# Altium project LED-PCBs.PrjPcb (part 1 of 2)
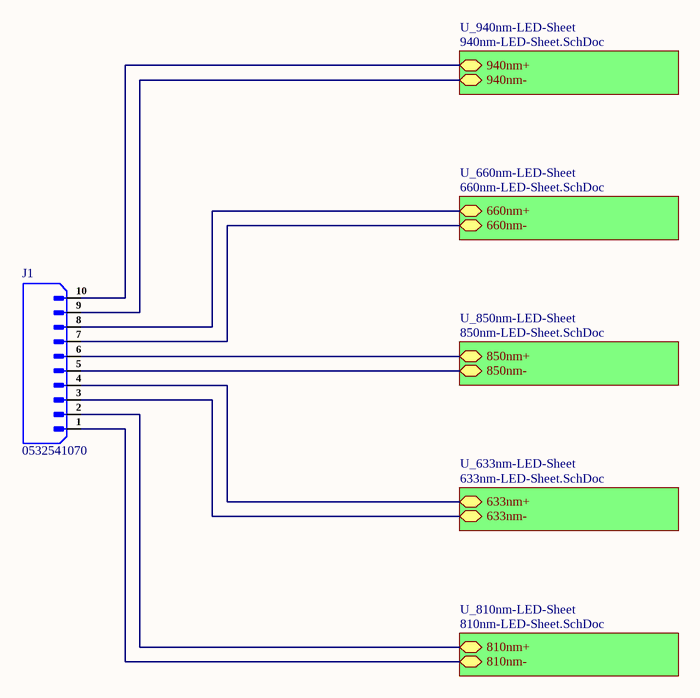
[diagram p0: Main-Sheet.SchDoc]
6 sheets, 801 parts. Net scope: hierarchical (ports join the sheet entries above them; power ports are global).
Sheets:
  Main-Sheet.SchDoc
    U_633nm-LED-Sheet = 633nm-LED-Sheet.SchDoc
    U_660nm-LED-Sheet = 660nm-LED-Sheet.SchDoc
    U_810nm-LED-Sheet = 810nm-LED-Sheet.SchDoc
    U_850nm-LED-Sheet = 850nm-LED-Sheet.SchDoc
    U_940nm-LED-Sheet = 940nm-LED-Sheet.SchDoc

## Sheet Main-Sheet.SchDoc
size 420 x 297 mm; SheetNumber: 1; SheetTotal: 6

### Parts
J1  0532541070  [0532541070]

### Sub-sheets
U_633nm-LED-Sheet = 633nm-LED-Sheet.SchDoc: 633nm+ (bidir), 633nm- (bidir)
U_660nm-LED-Sheet = 660nm-LED-Sheet.SchDoc: 660nm+ (bidir), 660nm- (bidir)
U_810nm-LED-Sheet = 810nm-LED-Sheet.SchDoc: 810nm+ (bidir), 810nm- (bidir)
U_850nm-LED-Sheet = 850nm-LED-Sheet.SchDoc: 850nm+ (bidir), 850nm- (bidir)
U_940nm-LED-Sheet = 940nm-LED-Sheet.SchDoc: 940nm+ (bidir), 940nm- (bidir)

### Nets
633nm+: J1.4 ; sheet U_633nm-LED-Sheet/633nm+
633nm-: J1.3 ; sheet U_633nm-LED-Sheet/633nm-
660nm+: J1.8 ; sheet U_660nm-LED-Sheet/660nm+
660nm-: J1.7 ; sheet U_660nm-LED-Sheet/660nm-
810nm+: J1.2 ; sheet U_810nm-LED-Sheet/810nm+
810nm-: J1.1 ; sheet U_810nm-LED-Sheet/810nm-
850nm+: J1.6 ; sheet U_850nm-LED-Sheet/850nm+
850nm-: J1.5 ; sheet U_850nm-LED-Sheet/850nm-
940nm+: J1.10 ; sheet U_940nm-LED-Sheet/940nm+
940nm-: J1.9 ; sheet U_940nm-LED-Sheet/940nm-

### Notes on the sheet
- File:
- Title:
- Date:
- Page
- Num:
- Total:
- Drawn By: Huzaifa Ali

### Library data of the parts
J1 = 0532541070: CONN HEADER R/A 10POS 2MM; Manufacturer: Molex; Manufacturer Part Number: 53254-1070; Item Type: Headers and Wire Housings; Plating: Tin; Voltage Rating: 125V; Current Rating: 2A; Number of Positions: 10; Gender: Male; Number of Circuits: 9; Glow Wire Compliant: Non-compliant; Supplier: Arrow Electronics; Supplier Part Number: 53254-1070; RoHS: Yes; Stock: 4800; Pricing: 4800=0.2383, 6000=0.2327, 10000=0.2292, 20000=0.2263, 30000=0.2219, 50000=0.2176, 100000=0.2136 (USD); Mounting Technology: Through Hole; Contact Plating: Tin; Contact Material: Brass; Housing Material: Nylon; Min Operating Temperature: -40°C; Max Operating Temperature: 105°C; Number of Rows: 1; Packaging: Tray; Contact Gender: Male; Termination: Through Hole; Number of Contacts: 10; Orientation: Right Angle; Series: 53254; Pitch: 2mm; RoHS Compliant: Yes; Reach SVHC Compliant: Unknown; ComponentLink1URL: https://datasheet.ciiva.com/7810/0532541070-pcb-headers-7810534.pdf?src-supplier=Element14; ComponentLink1Description: https://datasheet.ciiva.com/7810/0532541070-pcb-headers-7810534.pdf?src-supplier=Element14

## Sheet 633nm-LED-Sheet.SchDoc
size 420 x 297 mm; SheetNumber: 2; SheetTotal: 6
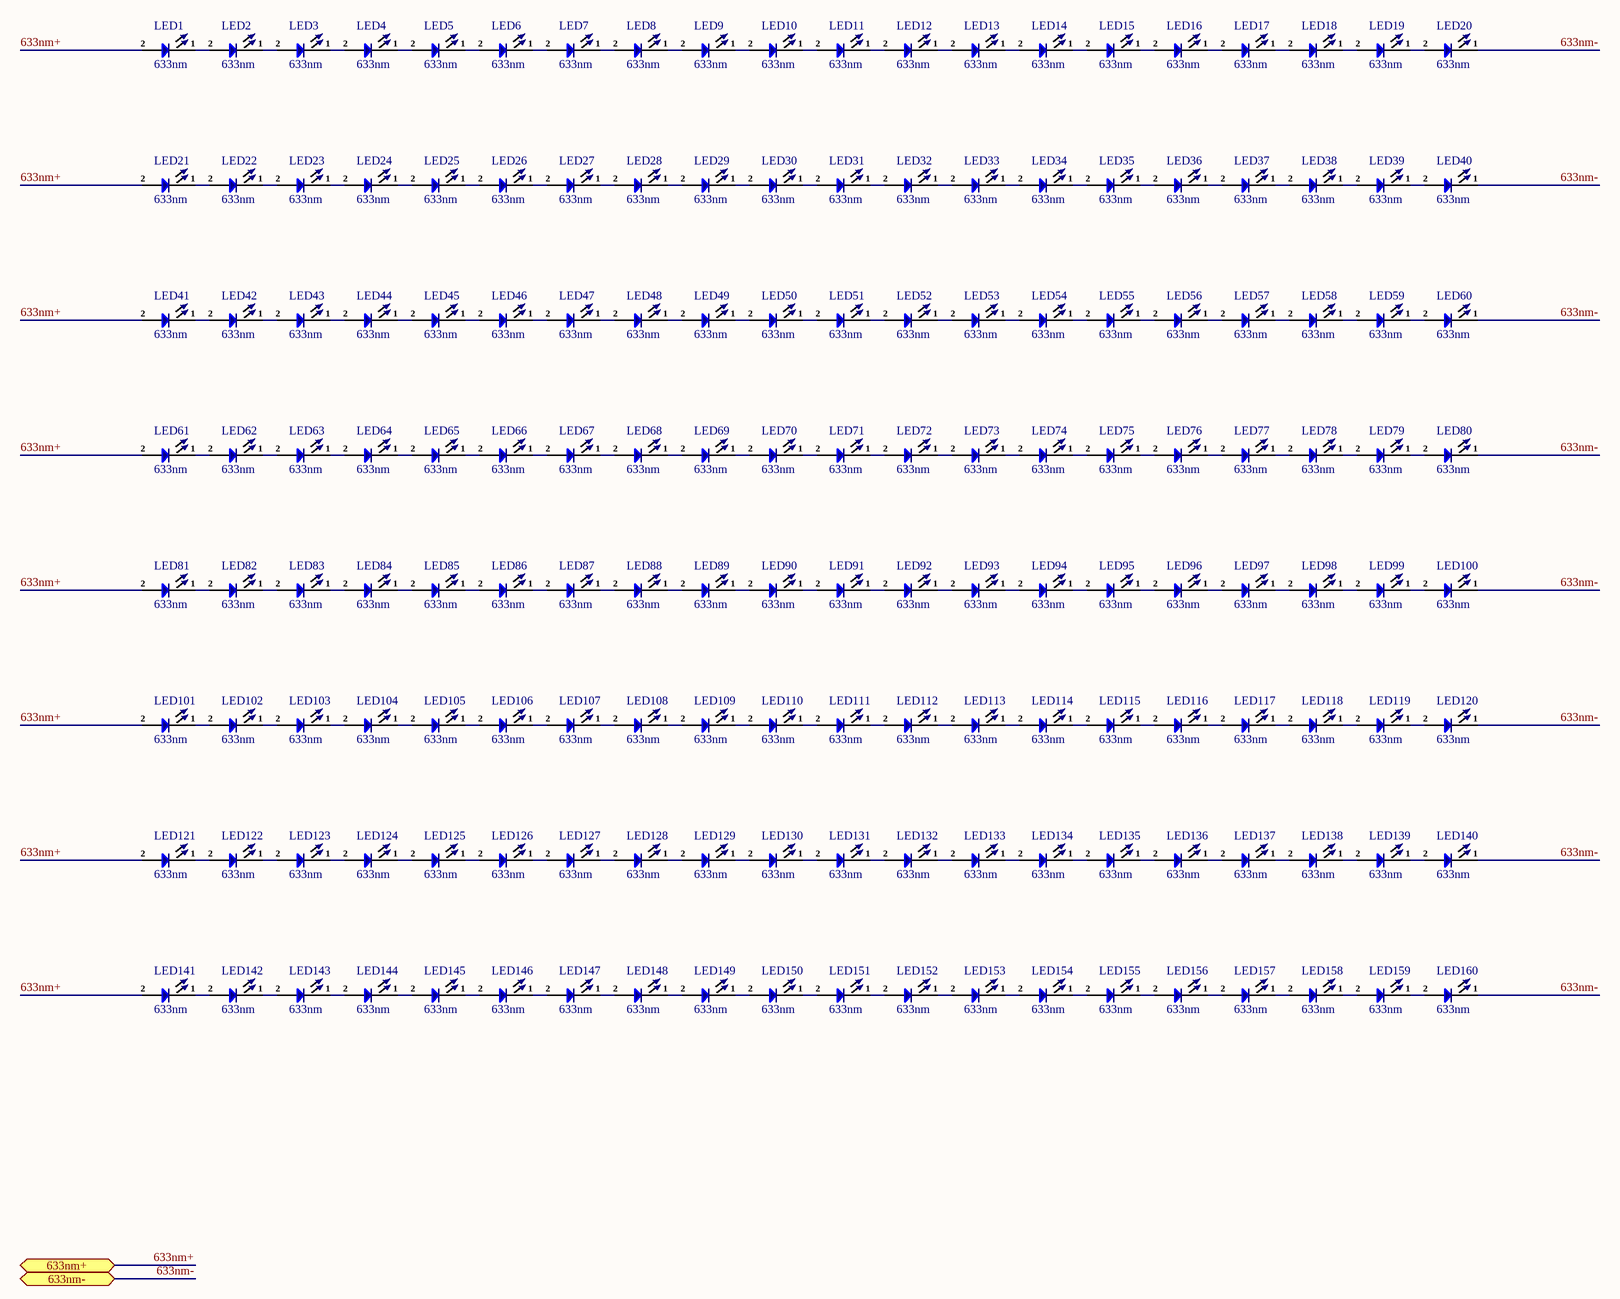
[diagram p1: 633nm-LED-Sheet.SchDoc]

### Parts
LED1  633nm  [TH LED 3mm_]
LED2  633nm  [TH LED 3mm_]
LED3  633nm  [TH LED 3mm_]
LED4  633nm  [TH LED 3mm_]
LED5  633nm  [TH LED 3mm_]
LED6  633nm  [TH LED 3mm_]
LED7  633nm  [TH LED 3mm_]
LED8  633nm  [TH LED 3mm_]
LED9  633nm  [TH LED 3mm_]
LED10  633nm  [TH LED 3mm_]
LED11  633nm  [TH LED 3mm_]
LED12  633nm  [TH LED 3mm_]
LED13  633nm  [TH LED 3mm_]
LED14  633nm  [TH LED 3mm_]
LED15  633nm  [TH LED 3mm_]
LED16  633nm  [TH LED 3mm_]
LED17  633nm  [TH LED 3mm_]
LED18  633nm  [TH LED 3mm_]
LED19  633nm  [TH LED 3mm_]
LED20  633nm  [TH LED 3mm_]
LED21  633nm  [TH LED 3mm_]
LED22  633nm  [TH LED 3mm_]
LED23  633nm  [TH LED 3mm_]
LED24  633nm  [TH LED 3mm_]
LED25  633nm  [TH LED 3mm_]
LED26  633nm  [TH LED 3mm_]
LED27  633nm  [TH LED 3mm_]
LED28  633nm  [TH LED 3mm_]
LED29  633nm  [TH LED 3mm_]
LED30  633nm  [TH LED 3mm_]
LED31  633nm  [TH LED 3mm_]
LED32  633nm  [TH LED 3mm_]
LED33  633nm  [TH LED 3mm_]
LED34  633nm  [TH LED 3mm_]
LED35  633nm  [TH LED 3mm_]
LED36  633nm  [TH LED 3mm_]
LED37  633nm  [TH LED 3mm_]
LED38  633nm  [TH LED 3mm_]
LED39  633nm  [TH LED 3mm_]
LED40  633nm  [TH LED 3mm_]
LED41  633nm  [TH LED 3mm_]
LED42  633nm  [TH LED 3mm_]
LED43  633nm  [TH LED 3mm_]
LED44  633nm  [TH LED 3mm_]
LED45  633nm  [TH LED 3mm_]
LED46  633nm  [TH LED 3mm_]
LED47  633nm  [TH LED 3mm_]
LED48  633nm  [TH LED 3mm_]
LED49  633nm  [TH LED 3mm_]
LED50  633nm  [TH LED 3mm_]
LED51  633nm  [TH LED 3mm_]
LED52  633nm  [TH LED 3mm_]
LED53  633nm  [TH LED 3mm_]
LED54  633nm  [TH LED 3mm_]
LED55  633nm  [TH LED 3mm_]
LED56  633nm  [TH LED 3mm_]
LED57  633nm  [TH LED 3mm_]
LED58  633nm  [TH LED 3mm_]
LED59  633nm  [TH LED 3mm_]
LED60  633nm  [TH LED 3mm_]
LED61  633nm  [TH LED 3mm_]
LED62  633nm  [TH LED 3mm_]
LED63  633nm  [TH LED 3mm_]
LED64  633nm  [TH LED 3mm_]
LED65  633nm  [TH LED 3mm_]
LED66  633nm  [TH LED 3mm_]
LED67  633nm  [TH LED 3mm_]
LED68  633nm  [TH LED 3mm_]
LED69  633nm  [TH LED 3mm_]
LED70  633nm  [TH LED 3mm_]
LED71  633nm  [TH LED 3mm_]
LED72  633nm  [TH LED 3mm_]
LED73  633nm  [TH LED 3mm_]
LED74  633nm  [TH LED 3mm_]
LED75  633nm  [TH LED 3mm_]
LED76  633nm  [TH LED 3mm_]
LED77  633nm  [TH LED 3mm_]
LED78  633nm  [TH LED 3mm_]
LED79  633nm  [TH LED 3mm_]
LED80  633nm  [TH LED 3mm_]
LED81  633nm  [TH LED 3mm_]
LED82  633nm  [TH LED 3mm_]
LED83  633nm  [TH LED 3mm_]
LED84  633nm  [TH LED 3mm_]
LED85  633nm  [TH LED 3mm_]
LED86  633nm  [TH LED 3mm_]
LED87  633nm  [TH LED 3mm_]
LED88  633nm  [TH LED 3mm_]
LED89  633nm  [TH LED 3mm_]
LED90  633nm  [TH LED 3mm_]
LED91  633nm  [TH LED 3mm_]
LED92  633nm  [TH LED 3mm_]
LED93  633nm  [TH LED 3mm_]
LED94  633nm  [TH LED 3mm_]
LED95  633nm  [TH LED 3mm_]
LED96  633nm  [TH LED 3mm_]
LED97  633nm  [TH LED 3mm_]
LED98  633nm  [TH LED 3mm_]
LED99  633nm  [TH LED 3mm_]
LED100  633nm  [TH LED 3mm_]
LED101  633nm  [TH LED 3mm_]
LED102  633nm  [TH LED 3mm_]
LED103  633nm  [TH LED 3mm_]
LED104  633nm  [TH LED 3mm_]
LED105  633nm  [TH LED 3mm_]
LED106  633nm  [TH LED 3mm_]
LED107  633nm  [TH LED 3mm_]
LED108  633nm  [TH LED 3mm_]
LED109  633nm  [TH LED 3mm_]
LED110  633nm  [TH LED 3mm_]
LED111  633nm  [TH LED 3mm_]
LED112  633nm  [TH LED 3mm_]
LED113  633nm  [TH LED 3mm_]
LED114  633nm  [TH LED 3mm_]
LED115  633nm  [TH LED 3mm_]
LED116  633nm  [TH LED 3mm_]
LED117  633nm  [TH LED 3mm_]
LED118  633nm  [TH LED 3mm_]
LED119  633nm  [TH LED 3mm_]
LED120  633nm  [TH LED 3mm_]
LED121  633nm  [TH LED 3mm_]
LED122  633nm  [TH LED 3mm_]
LED123  633nm  [TH LED 3mm_]
LED124  633nm  [TH LED 3mm_]
LED125  633nm  [TH LED 3mm_]
LED126  633nm  [TH LED 3mm_]
LED127  633nm  [TH LED 3mm_]
LED128  633nm  [TH LED 3mm_]
LED129  633nm  [TH LED 3mm_]
LED130  633nm  [TH LED 3mm_]
LED131  633nm  [TH LED 3mm_]
LED132  633nm  [TH LED 3mm_]
LED133  633nm  [TH LED 3mm_]
LED134  633nm  [TH LED 3mm_]
LED135  633nm  [TH LED 3mm_]
LED136  633nm  [TH LED 3mm_]
LED137  633nm  [TH LED 3mm_]
LED138  633nm  [TH LED 3mm_]
LED139  633nm  [TH LED 3mm_]
LED140  633nm  [TH LED 3mm_]
LED141  633nm  [TH LED 3mm_]
LED142  633nm  [TH LED 3mm_]
LED143  633nm  [TH LED 3mm_]
LED144  633nm  [TH LED 3mm_]
LED145  633nm  [TH LED 3mm_]
LED146  633nm  [TH LED 3mm_]
LED147  633nm  [TH LED 3mm_]
LED148  633nm  [TH LED 3mm_]
LED149  633nm  [TH LED 3mm_]
LED150  633nm  [TH LED 3mm_]
LED151  633nm  [TH LED 3mm_]
LED152  633nm  [TH LED 3mm_]
LED153  633nm  [TH LED 3mm_]
LED154  633nm  [TH LED 3mm_]
LED155  633nm  [TH LED 3mm_]
LED156  633nm  [TH LED 3mm_]
LED157  633nm  [TH LED 3mm_]
LED158  633nm  [TH LED 3mm_]
LED159  633nm  [TH LED 3mm_]
LED160  633nm  [TH LED 3mm_]

### Ports
633nm+ (bidir, see Main-Sheet[4B]), 633nm- (bidir, see Main-Sheet[4B])

### Nets
633nm+: LED1.2 LED21.2 LED41.2 LED61.2 LED81.2 LED101.2 LED121.2 LED141.2 ; port 633nm+
633nm-: LED20.1 LED40.1 LED60.1 LED80.1 LED100.1 LED120.1 LED140.1 LED160.1 ; port 633nm-
NetLED1_1: LED1.1 LED2.2
NetLED2_1: LED2.1 LED3.2
NetLED3_1: LED3.1 LED4.2
NetLED4_1: LED4.1 LED5.2
NetLED5_1: LED5.1 LED6.2
NetLED6_1: LED6.1 LED7.2
NetLED7_1: LED7.1 LED8.2
NetLED8_1: LED8.1 LED9.2
NetLED9_1: LED9.1 LED10.2
NetLED10_1: LED10.1 LED11.2
NetLED11_1: LED11.1 LED12.2
NetLED12_1: LED12.1 LED13.2
NetLED13_1: LED13.1 LED14.2
NetLED14_1: LED14.1 LED15.2
NetLED15_1: LED15.1 LED16.2
NetLED16_1: LED16.1 LED17.2
NetLED17_1: LED17.1 LED18.2
NetLED18_1: LED18.1 LED19.2
NetLED19_1: LED19.1 LED20.2
NetLED21_1: LED21.1 LED22.2
NetLED22_1: LED22.1 LED23.2
NetLED23_1: LED23.1 LED24.2
NetLED24_1: LED24.1 LED25.2
NetLED25_1: LED25.1 LED26.2
NetLED26_1: LED26.1 LED27.2
NetLED27_1: LED27.1 LED28.2
NetLED28_1: LED28.1 LED29.2
NetLED29_1: LED29.1 LED30.2
NetLED30_1: LED30.1 LED31.2
NetLED31_1: LED31.1 LED32.2
NetLED32_1: LED32.1 LED33.2
NetLED33_1: LED33.1 LED34.2
NetLED34_1: LED34.1 LED35.2
NetLED35_1: LED35.1 LED36.2
NetLED36_1: LED36.1 LED37.2
NetLED37_1: LED37.1 LED38.2
NetLED38_1: LED38.1 LED39.2
NetLED39_1: LED39.1 LED40.2
NetLED41_1: LED41.1 LED42.2
NetLED42_1: LED42.1 LED43.2
NetLED43_1: LED43.1 LED44.2
NetLED44_1: LED44.1 LED45.2
NetLED45_1: LED45.1 LED46.2
NetLED46_1: LED46.1 LED47.2
NetLED47_1: LED47.1 LED48.2
NetLED48_1: LED48.1 LED49.2
NetLED49_1: LED49.1 LED50.2
NetLED50_1: LED50.1 LED51.2
NetLED51_1: LED51.1 LED52.2
NetLED52_1: LED52.1 LED53.2
NetLED53_1: LED53.1 LED54.2
NetLED54_1: LED54.1 LED55.2
NetLED55_1: LED55.1 LED56.2
NetLED56_1: LED56.1 LED57.2
NetLED57_1: LED57.1 LED58.2
NetLED58_1: LED58.1 LED59.2
NetLED59_1: LED59.1 LED60.2
NetLED61_1: LED61.1 LED62.2
NetLED62_1: LED62.1 LED63.2
NetLED63_1: LED63.1 LED64.2
NetLED64_1: LED64.1 LED65.2
NetLED65_1: LED65.1 LED66.2
NetLED66_1: LED66.1 LED67.2
NetLED67_1: LED67.1 LED68.2
NetLED68_1: LED68.1 LED69.2
NetLED69_1: LED69.1 LED70.2
NetLED70_1: LED70.1 LED71.2
NetLED71_1: LED71.1 LED72.2
NetLED72_1: LED72.1 LED73.2
NetLED73_1: LED73.1 LED74.2
NetLED74_1: LED74.1 LED75.2
NetLED75_1: LED75.1 LED76.2
NetLED76_1: LED76.1 LED77.2
NetLED77_1: LED77.1 LED78.2
NetLED78_1: LED78.1 LED79.2
NetLED79_1: LED79.1 LED80.2
NetLED81_1: LED81.1 LED82.2
NetLED82_1: LED82.1 LED83.2
NetLED83_1: LED83.1 LED84.2
NetLED84_1: LED84.1 LED85.2
NetLED85_1: LED85.1 LED86.2
NetLED86_1: LED86.1 LED87.2
NetLED87_1: LED87.1 LED88.2
NetLED88_1: LED88.1 LED89.2
NetLED89_1: LED89.1 LED90.2
NetLED90_1: LED90.1 LED91.2
NetLED91_1: LED91.1 LED92.2
NetLED92_1: LED92.1 LED93.2
NetLED93_1: LED93.1 LED94.2
NetLED94_1: LED94.1 LED95.2
NetLED95_1: LED95.1 LED96.2
NetLED96_1: LED96.1 LED97.2
NetLED97_1: LED97.1 LED98.2
NetLED98_1: LED98.1 LED99.2
NetLED99_1: LED99.1 LED100.2
NetLED101_1: LED101.1 LED102.2
NetLED102_1: LED102.1 LED103.2
NetLED103_1: LED103.1 LED104.2
NetLED104_1: LED104.1 LED105.2
NetLED105_1: LED105.1 LED106.2
NetLED106_1: LED106.1 LED107.2
NetLED107_1: LED107.1 LED108.2
NetLED108_1: LED108.1 LED109.2
NetLED109_1: LED109.1 LED110.2
NetLED110_1: LED110.1 LED111.2
NetLED111_1: LED111.1 LED112.2
NetLED112_1: LED112.1 LED113.2
NetLED113_1: LED113.1 LED114.2
NetLED114_1: LED114.1 LED115.2
NetLED115_1: LED115.1 LED116.2
NetLED116_1: LED116.1 LED117.2
NetLED117_1: LED117.1 LED118.2
NetLED118_1: LED118.1 LED119.2
NetLED119_1: LED119.1 LED120.2
NetLED121_1: LED121.1 LED122.2
NetLED122_1: LED122.1 LED123.2
NetLED123_1: LED123.1 LED124.2
NetLED124_1: LED124.1 LED125.2
NetLED125_1: LED125.1 LED126.2
NetLED126_1: LED126.1 LED127.2
NetLED127_1: LED127.1 LED128.2
NetLED128_1: LED128.1 LED129.2
NetLED129_1: LED129.1 LED130.2
NetLED130_1: LED130.1 LED131.2
NetLED131_1: LED131.1 LED132.2
NetLED132_1: LED132.1 LED133.2
NetLED133_1: LED133.1 LED134.2
NetLED134_1: LED134.1 LED135.2
NetLED135_1: LED135.1 LED136.2
NetLED136_1: LED136.1 LED137.2
NetLED137_1: LED137.1 LED138.2
NetLED138_1: LED138.1 LED139.2
NetLED139_1: LED139.1 LED140.2
NetLED141_1: LED141.1 LED142.2
NetLED142_1: LED142.1 LED143.2
NetLED143_1: LED143.1 LED144.2
NetLED144_1: LED144.1 LED145.2
NetLED145_1: LED145.1 LED146.2
NetLED146_1: LED146.1 LED147.2
NetLED147_1: LED147.1 LED148.2
NetLED148_1: LED148.1 LED149.2
NetLED149_1: LED149.1 LED150.2
NetLED150_1: LED150.1 LED151.2
NetLED151_1: LED151.1 LED152.2
NetLED152_1: LED152.1 LED153.2
NetLED153_1: LED153.1 LED154.2
NetLED154_1: LED154.1 LED155.2
NetLED155_1: LED155.1 LED156.2
NetLED156_1: LED156.1 LED157.2
NetLED157_1: LED157.1 LED158.2
NetLED158_1: LED158.1 LED159.2
NetLED159_1: LED159.1 LED160.2

### Notes on the sheet
- File:
- Title:
- Date:
- Page
- Num:
- Total:
- Drawn By: Huzaifa Ali

### Library data of the parts
LED1-LED160 = IR LED 3mm: IR Led 3mm Through; ComponentLink1Description: Aliexpress; ComponentLink1URL: https://nl.aliexpress.com/item/32950109432.html?spm=a2g0o.productlist.0.0.2d9749ecxdTGvK&algo_pvid=f3c88197-d0dd-4360-badc-ef5a9d1d435b&algo_exp_id=f3c88197-d0dd-4360-badc-ef5a9d1d435b-1&pdp_ext_f=%7B%22sku_id%22%3A%2266309321327%22%7D

## Sheet 660nm-LED-Sheet.SchDoc
size 420 x 297 mm; SheetNumber: 3; SheetTotal: 6
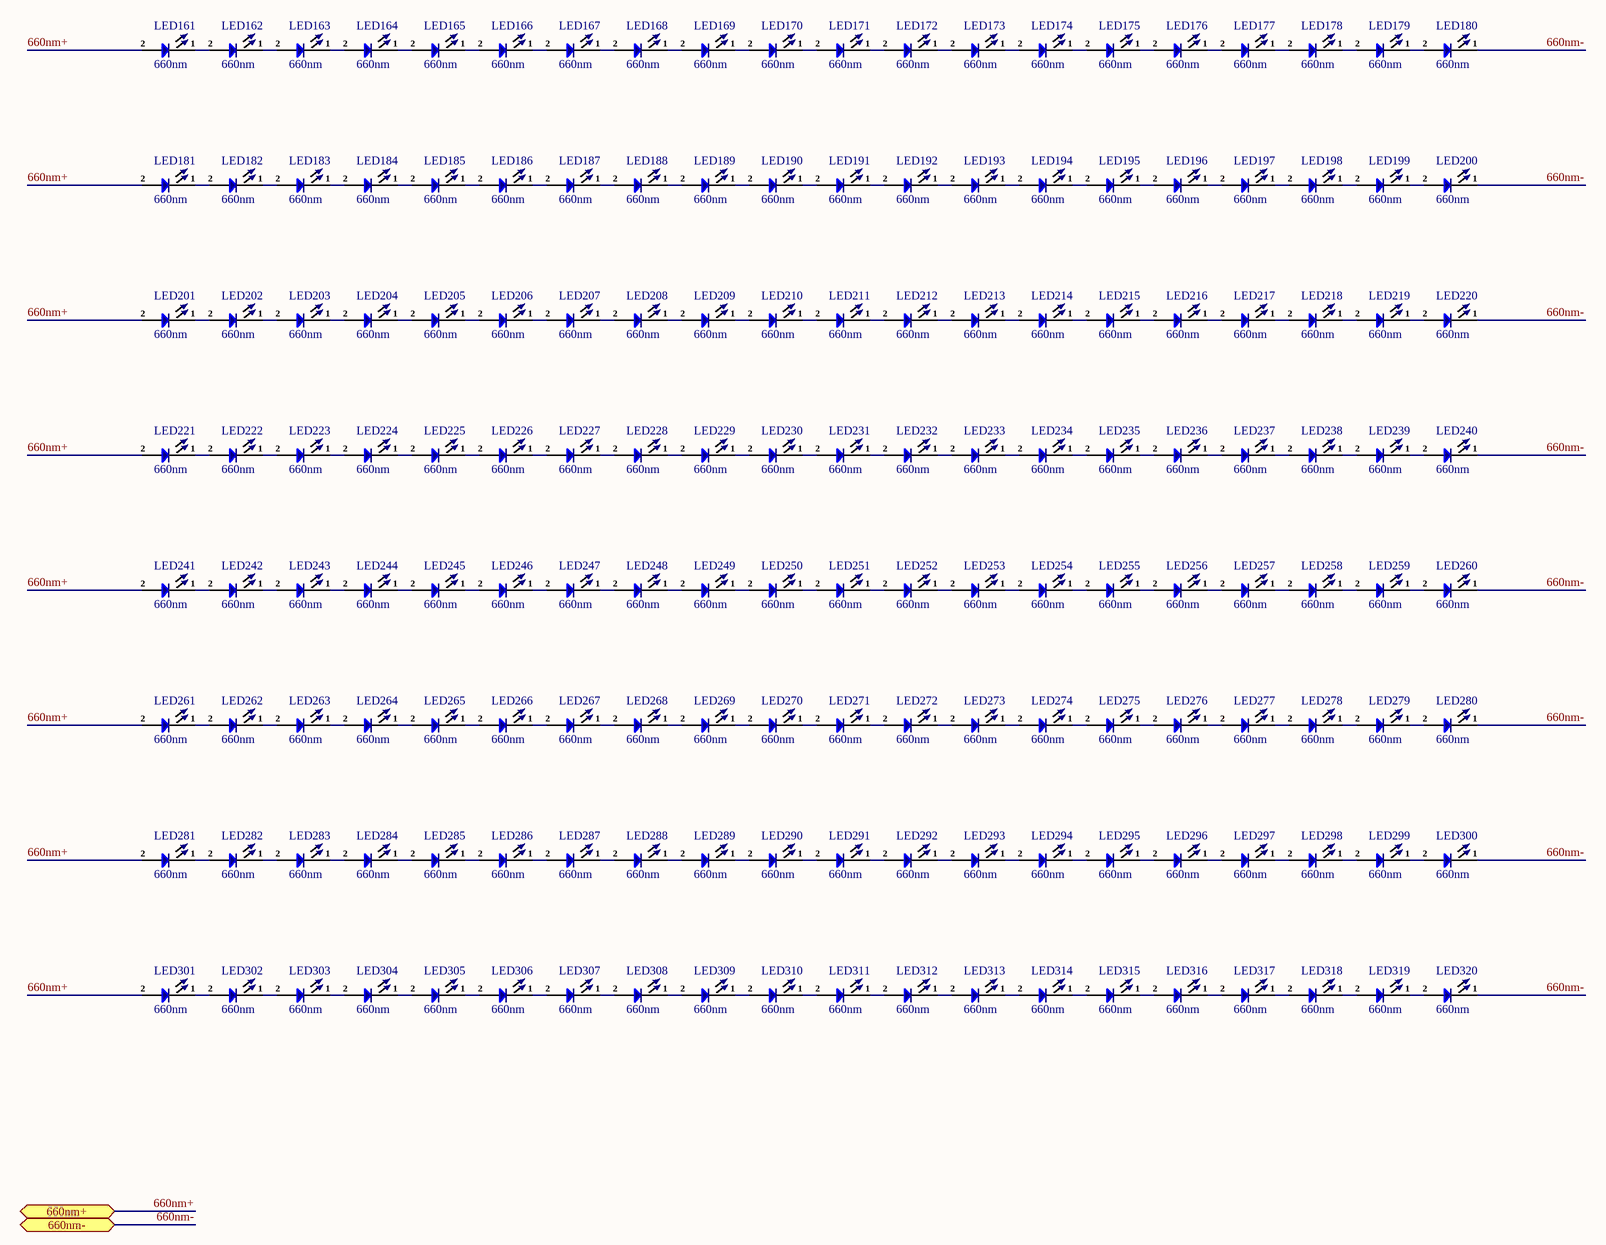
[diagram p2: 660nm-LED-Sheet.SchDoc]

### Parts
LED161  660nm  [TH LED 3mm_]
LED162  660nm  [TH LED 3mm_]
LED163  660nm  [TH LED 3mm_]
LED164  660nm  [TH LED 3mm_]
LED165  660nm  [TH LED 3mm_]
LED166  660nm  [TH LED 3mm_]
LED167  660nm  [TH LED 3mm_]
LED168  660nm  [TH LED 3mm_]
LED169  660nm  [TH LED 3mm_]
LED170  660nm  [TH LED 3mm_]
LED171  660nm  [TH LED 3mm_]
LED172  660nm  [TH LED 3mm_]
LED173  660nm  [TH LED 3mm_]
LED174  660nm  [TH LED 3mm_]
LED175  660nm  [TH LED 3mm_]
LED176  660nm  [TH LED 3mm_]
LED177  660nm  [TH LED 3mm_]
LED178  660nm  [TH LED 3mm_]
LED179  660nm  [TH LED 3mm_]
LED180  660nm  [TH LED 3mm_]
LED181  660nm  [TH LED 3mm_]
LED182  660nm  [TH LED 3mm_]
LED183  660nm  [TH LED 3mm_]
LED184  660nm  [TH LED 3mm_]
LED185  660nm  [TH LED 3mm_]
LED186  660nm  [TH LED 3mm_]
LED187  660nm  [TH LED 3mm_]
LED188  660nm  [TH LED 3mm_]
LED189  660nm  [TH LED 3mm_]
LED190  660nm  [TH LED 3mm_]
LED191  660nm  [TH LED 3mm_]
LED192  660nm  [TH LED 3mm_]
LED193  660nm  [TH LED 3mm_]
LED194  660nm  [TH LED 3mm_]
LED195  660nm  [TH LED 3mm_]
LED196  660nm  [TH LED 3mm_]
LED197  660nm  [TH LED 3mm_]
LED198  660nm  [TH LED 3mm_]
LED199  660nm  [TH LED 3mm_]
LED200  660nm  [TH LED 3mm_]
LED201  660nm  [TH LED 3mm_]
LED202  660nm  [TH LED 3mm_]
LED203  660nm  [TH LED 3mm_]
LED204  660nm  [TH LED 3mm_]
LED205  660nm  [TH LED 3mm_]
LED206  660nm  [TH LED 3mm_]
LED207  660nm  [TH LED 3mm_]
LED208  660nm  [TH LED 3mm_]
LED209  660nm  [TH LED 3mm_]
LED210  660nm  [TH LED 3mm_]
LED211  660nm  [TH LED 3mm_]
LED212  660nm  [TH LED 3mm_]
LED213  660nm  [TH LED 3mm_]
LED214  660nm  [TH LED 3mm_]
LED215  660nm  [TH LED 3mm_]
LED216  660nm  [TH LED 3mm_]
LED217  660nm  [TH LED 3mm_]
LED218  660nm  [TH LED 3mm_]
LED219  660nm  [TH LED 3mm_]
LED220  660nm  [TH LED 3mm_]
LED221  660nm  [TH LED 3mm_]
LED222  660nm  [TH LED 3mm_]
LED223  660nm  [TH LED 3mm_]
LED224  660nm  [TH LED 3mm_]
LED225  660nm  [TH LED 3mm_]
LED226  660nm  [TH LED 3mm_]
LED227  660nm  [TH LED 3mm_]
LED228  660nm  [TH LED 3mm_]
LED229  660nm  [TH LED 3mm_]
LED230  660nm  [TH LED 3mm_]
LED231  660nm  [TH LED 3mm_]
LED232  660nm  [TH LED 3mm_]
LED233  660nm  [TH LED 3mm_]
LED234  660nm  [TH LED 3mm_]
LED235  660nm  [TH LED 3mm_]
LED236  660nm  [TH LED 3mm_]
LED237  660nm  [TH LED 3mm_]
LED238  660nm  [TH LED 3mm_]
LED239  660nm  [TH LED 3mm_]
LED240  660nm  [TH LED 3mm_]
LED241  660nm  [TH LED 3mm_]
LED242  660nm  [TH LED 3mm_]
LED243  660nm  [TH LED 3mm_]
LED244  660nm  [TH LED 3mm_]
LED245  660nm  [TH LED 3mm_]
LED246  660nm  [TH LED 3mm_]
LED247  660nm  [TH LED 3mm_]
LED248  660nm  [TH LED 3mm_]
LED249  660nm  [TH LED 3mm_]
LED250  660nm  [TH LED 3mm_]
LED251  660nm  [TH LED 3mm_]
LED252  660nm  [TH LED 3mm_]
LED253  660nm  [TH LED 3mm_]
LED254  660nm  [TH LED 3mm_]
LED255  660nm  [TH LED 3mm_]
LED256  660nm  [TH LED 3mm_]
LED257  660nm  [TH LED 3mm_]
LED258  660nm  [TH LED 3mm_]
LED259  660nm  [TH LED 3mm_]
LED260  660nm  [TH LED 3mm_]
LED261  660nm  [TH LED 3mm_]
LED262  660nm  [TH LED 3mm_]
LED263  660nm  [TH LED 3mm_]
LED264  660nm  [TH LED 3mm_]
LED265  660nm  [TH LED 3mm_]
LED266  660nm  [TH LED 3mm_]
LED267  660nm  [TH LED 3mm_]
LED268  660nm  [TH LED 3mm_]
LED269  660nm  [TH LED 3mm_]
LED270  660nm  [TH LED 3mm_]
LED271  660nm  [TH LED 3mm_]
LED272  660nm  [TH LED 3mm_]
LED273  660nm  [TH LED 3mm_]
LED274  660nm  [TH LED 3mm_]
LED275  660nm  [TH LED 3mm_]
LED276  660nm  [TH LED 3mm_]
LED277  660nm  [TH LED 3mm_]
LED278  660nm  [TH LED 3mm_]
LED279  660nm  [TH LED 3mm_]
LED280  660nm  [TH LED 3mm_]
LED281  660nm  [TH LED 3mm_]
LED282  660nm  [TH LED 3mm_]
LED283  660nm  [TH LED 3mm_]
LED284  660nm  [TH LED 3mm_]
LED285  660nm  [TH LED 3mm_]
LED286  660nm  [TH LED 3mm_]
LED287  660nm  [TH LED 3mm_]
LED288  660nm  [TH LED 3mm_]
LED289  660nm  [TH LED 3mm_]
LED290  660nm  [TH LED 3mm_]
LED291  660nm  [TH LED 3mm_]
LED292  660nm  [TH LED 3mm_]
LED293  660nm  [TH LED 3mm_]
LED294  660nm  [TH LED 3mm_]
LED295  660nm  [TH LED 3mm_]
LED296  660nm  [TH LED 3mm_]
LED297  660nm  [TH LED 3mm_]
LED298  660nm  [TH LED 3mm_]
LED299  660nm  [TH LED 3mm_]
LED300  660nm  [TH LED 3mm_]
LED301  660nm  [TH LED 3mm_]
LED302  660nm  [TH LED 3mm_]
LED303  660nm  [TH LED 3mm_]
LED304  660nm  [TH LED 3mm_]
LED305  660nm  [TH LED 3mm_]
LED306  660nm  [TH LED 3mm_]
LED307  660nm  [TH LED 3mm_]
LED308  660nm  [TH LED 3mm_]
LED309  660nm  [TH LED 3mm_]
LED310  660nm  [TH LED 3mm_]
LED311  660nm  [TH LED 3mm_]
LED312  660nm  [TH LED 3mm_]
LED313  660nm  [TH LED 3mm_]
LED314  660nm  [TH LED 3mm_]
LED315  660nm  [TH LED 3mm_]
LED316  660nm  [TH LED 3mm_]
LED317  660nm  [TH LED 3mm_]
LED318  660nm  [TH LED 3mm_]
LED319  660nm  [TH LED 3mm_]
LED320  660nm  [TH LED 3mm_]

### Ports
660nm+ (bidir, see Main-Sheet[4A]), 660nm- (bidir, see Main-Sheet[4A])

### Nets
660nm+: LED161.2 LED181.2 LED201.2 LED221.2 LED241.2 LED261.2 LED281.2 LED301.2 ; port 660nm+
660nm-: LED180.1 LED200.1 LED220.1 LED240.1 LED260.1 LED280.1 LED300.1 LED320.1 ; port 660nm-
NetLED161_1: LED161.1 LED162.2
NetLED162_1: LED162.1 LED163.2
NetLED163_1: LED163.1 LED164.2
NetLED164_1: LED164.1 LED165.2
NetLED165_1: LED165.1 LED166.2
NetLED166_1: LED166.1 LED167.2
NetLED167_1: LED167.1 LED168.2
NetLED168_1: LED168.1 LED169.2
NetLED169_1: LED169.1 LED170.2
NetLED170_1: LED170.1 LED171.2
NetLED171_1: LED171.1 LED172.2
NetLED172_1: LED172.1 LED173.2
NetLED173_1: LED173.1 LED174.2
NetLED174_1: LED174.1 LED175.2
NetLED175_1: LED175.1 LED176.2
NetLED176_1: LED176.1 LED177.2
NetLED177_1: LED177.1 LED178.2
NetLED178_1: LED178.1 LED179.2
NetLED179_1: LED179.1 LED180.2
NetLED181_1: LED181.1 LED182.2
NetLED182_1: LED182.1 LED183.2
NetLED183_1: LED183.1 LED184.2
NetLED184_1: LED184.1 LED185.2
NetLED185_1: LED185.1 LED186.2
NetLED186_1: LED186.1 LED187.2
NetLED187_1: LED187.1 LED188.2
NetLED188_1: LED188.1 LED189.2
NetLED189_1: LED189.1 LED190.2
NetLED190_1: LED190.1 LED191.2
NetLED191_1: LED191.1 LED192.2
NetLED192_1: LED192.1 LED193.2
NetLED193_1: LED193.1 LED194.2
NetLED194_1: LED194.1 LED195.2
NetLED195_1: LED195.1 LED196.2
NetLED196_1: LED196.1 LED197.2
NetLED197_1: LED197.1 LED198.2
NetLED198_1: LED198.1 LED199.2
NetLED199_1: LED199.1 LED200.2
NetLED201_1: LED201.1 LED202.2
NetLED202_1: LED202.1 LED203.2
NetLED203_1: LED203.1 LED204.2
NetLED204_1: LED204.1 LED205.2
NetLED205_1: LED205.1 LED206.2
NetLED206_1: LED206.1 LED207.2
NetLED207_1: LED207.1 LED208.2
NetLED208_1: LED208.1 LED209.2
NetLED209_1: LED209.1 LED210.2
NetLED210_1: LED210.1 LED211.2
NetLED211_1: LED211.1 LED212.2
NetLED212_1: LED212.1 LED213.2
NetLED213_1: LED213.1 LED214.2
NetLED214_1: LED214.1 LED215.2
NetLED215_1: LED215.1 LED216.2
NetLED216_1: LED216.1 LED217.2
NetLED217_1: LED217.1 LED218.2
NetLED218_1: LED218.1 LED219.2
NetLED219_1: LED219.1 LED220.2
NetLED221_1: LED221.1 LED222.2
NetLED222_1: LED222.1 LED223.2
NetLED223_1: LED223.1 LED224.2
NetLED224_1: LED224.1 LED225.2
NetLED225_1: LED225.1 LED226.2
NetLED226_1: LED226.1 LED227.2
NetLED227_1: LED227.1 LED228.2
NetLED228_1: LED228.1 LED229.2
NetLED229_1: LED229.1 LED230.2
NetLED230_1: LED230.1 LED231.2
NetLED231_1: LED231.1 LED232.2
NetLED232_1: LED232.1 LED233.2
NetLED233_1: LED233.1 LED234.2
NetLED234_1: LED234.1 LED235.2
NetLED235_1: LED235.1 LED236.2
NetLED236_1: LED236.1 LED237.2
NetLED237_1: LED237.1 LED238.2
NetLED238_1: LED238.1 LED239.2
NetLED239_1: LED239.1 LED240.2
NetLED241_1: LED241.1 LED242.2
NetLED242_1: LED242.1 LED243.2
NetLED243_1: LED243.1 LED244.2
NetLED244_1: LED244.1 LED245.2
NetLED245_1: LED245.1 LED246.2
NetLED246_1: LED246.1 LED247.2
NetLED247_1: LED247.1 LED248.2
NetLED248_1: LED248.1 LED249.2
NetLED249_1: LED249.1 LED250.2
NetLED250_1: LED250.1 LED251.2
NetLED251_1: LED251.1 LED252.2
NetLED252_1: LED252.1 LED253.2
NetLED253_1: LED253.1 LED254.2
NetLED254_1: LED254.1 LED255.2
NetLED255_1: LED255.1 LED256.2
NetLED256_1: LED256.1 LED257.2
NetLED257_1: LED257.1 LED258.2
NetLED258_1: LED258.1 LED259.2
NetLED259_1: LED259.1 LED260.2
NetLED261_1: LED261.1 LED262.2
NetLED262_1: LED262.1 LED263.2
NetLED263_1: LED263.1 LED264.2
NetLED264_1: LED264.1 LED265.2
NetLED265_1: LED265.1 LED266.2
NetLED266_1: LED266.1 LED267.2
NetLED267_1: LED267.1 LED268.2
NetLED268_1: LED268.1 LED269.2
NetLED269_1: LED269.1 LED270.2
NetLED270_1: LED270.1 LED271.2
NetLED271_1: LED271.1 LED272.2
NetLED272_1: LED272.1 LED273.2
NetLED273_1: LED273.1 LED274.2
NetLED274_1: LED274.1 LED275.2
NetLED275_1: LED275.1 LED276.2
NetLED276_1: LED276.1 LED277.2
NetLED277_1: LED277.1 LED278.2
NetLED278_1: LED278.1 LED279.2
NetLED279_1: LED279.1 LED280.2
NetLED281_1: LED281.1 LED282.2
NetLED282_1: LED282.1 LED283.2
NetLED283_1: LED283.1 LED284.2
NetLED284_1: LED284.1 LED285.2
NetLED285_1: LED285.1 LED286.2
NetLED286_1: LED286.1 LED287.2
NetLED287_1: LED287.1 LED288.2
NetLED288_1: LED288.1 LED289.2
NetLED289_1: LED289.1 LED290.2
NetLED290_1: LED290.1 LED291.2
NetLED291_1: LED291.1 LED292.2
NetLED292_1: LED292.1 LED293.2
NetLED293_1: LED293.1 LED294.2
NetLED294_1: LED294.1 LED295.2
NetLED295_1: LED295.1 LED296.2
NetLED296_1: LED296.1 LED297.2
NetLED297_1: LED297.1 LED298.2
NetLED298_1: LED298.1 LED299.2
NetLED299_1: LED299.1 LED300.2
NetLED301_1: LED301.1 LED302.2
NetLED302_1: LED302.1 LED303.2
NetLED303_1: LED303.1 LED304.2
NetLED304_1: LED304.1 LED305.2
NetLED305_1: LED305.1 LED306.2
NetLED306_1: LED306.1 LED307.2
NetLED307_1: LED307.1 LED308.2
NetLED308_1: LED308.1 LED309.2
NetLED309_1: LED309.1 LED310.2
NetLED310_1: LED310.1 LED311.2
NetLED311_1: LED311.1 LED312.2
NetLED312_1: LED312.1 LED313.2
NetLED313_1: LED313.1 LED314.2
NetLED314_1: LED314.1 LED315.2
NetLED315_1: LED315.1 LED316.2
NetLED316_1: LED316.1 LED317.2
NetLED317_1: LED317.1 LED318.2
NetLED318_1: LED318.1 LED319.2
NetLED319_1: LED319.1 LED320.2

### Notes on the sheet
- File:
- Title:
- Date:
- Page
- Num:
- Total:
- Drawn By: Huzaifa Ali

### Library data of the parts
LED161-LED320 = IR LED 3mm: IR Led 3mm Through; ComponentLink1Description: Aliexpress; ComponentLink1URL: https://nl.aliexpress.com/item/32950109432.html?spm=a2g0o.productlist.0.0.2d9749ecxdTGvK&algo_pvid=f3c88197-d0dd-4360-badc-ef5a9d1d435b&algo_exp_id=f3c88197-d0dd-4360-badc-ef5a9d1d435b-1&pdp_ext_f=%7B%22sku_id%22%3A%2266309321327%22%7D

## Sheet 810nm-LED-Sheet.SchDoc
size 420 x 297 mm; SheetNumber: 4; SheetTotal: 6
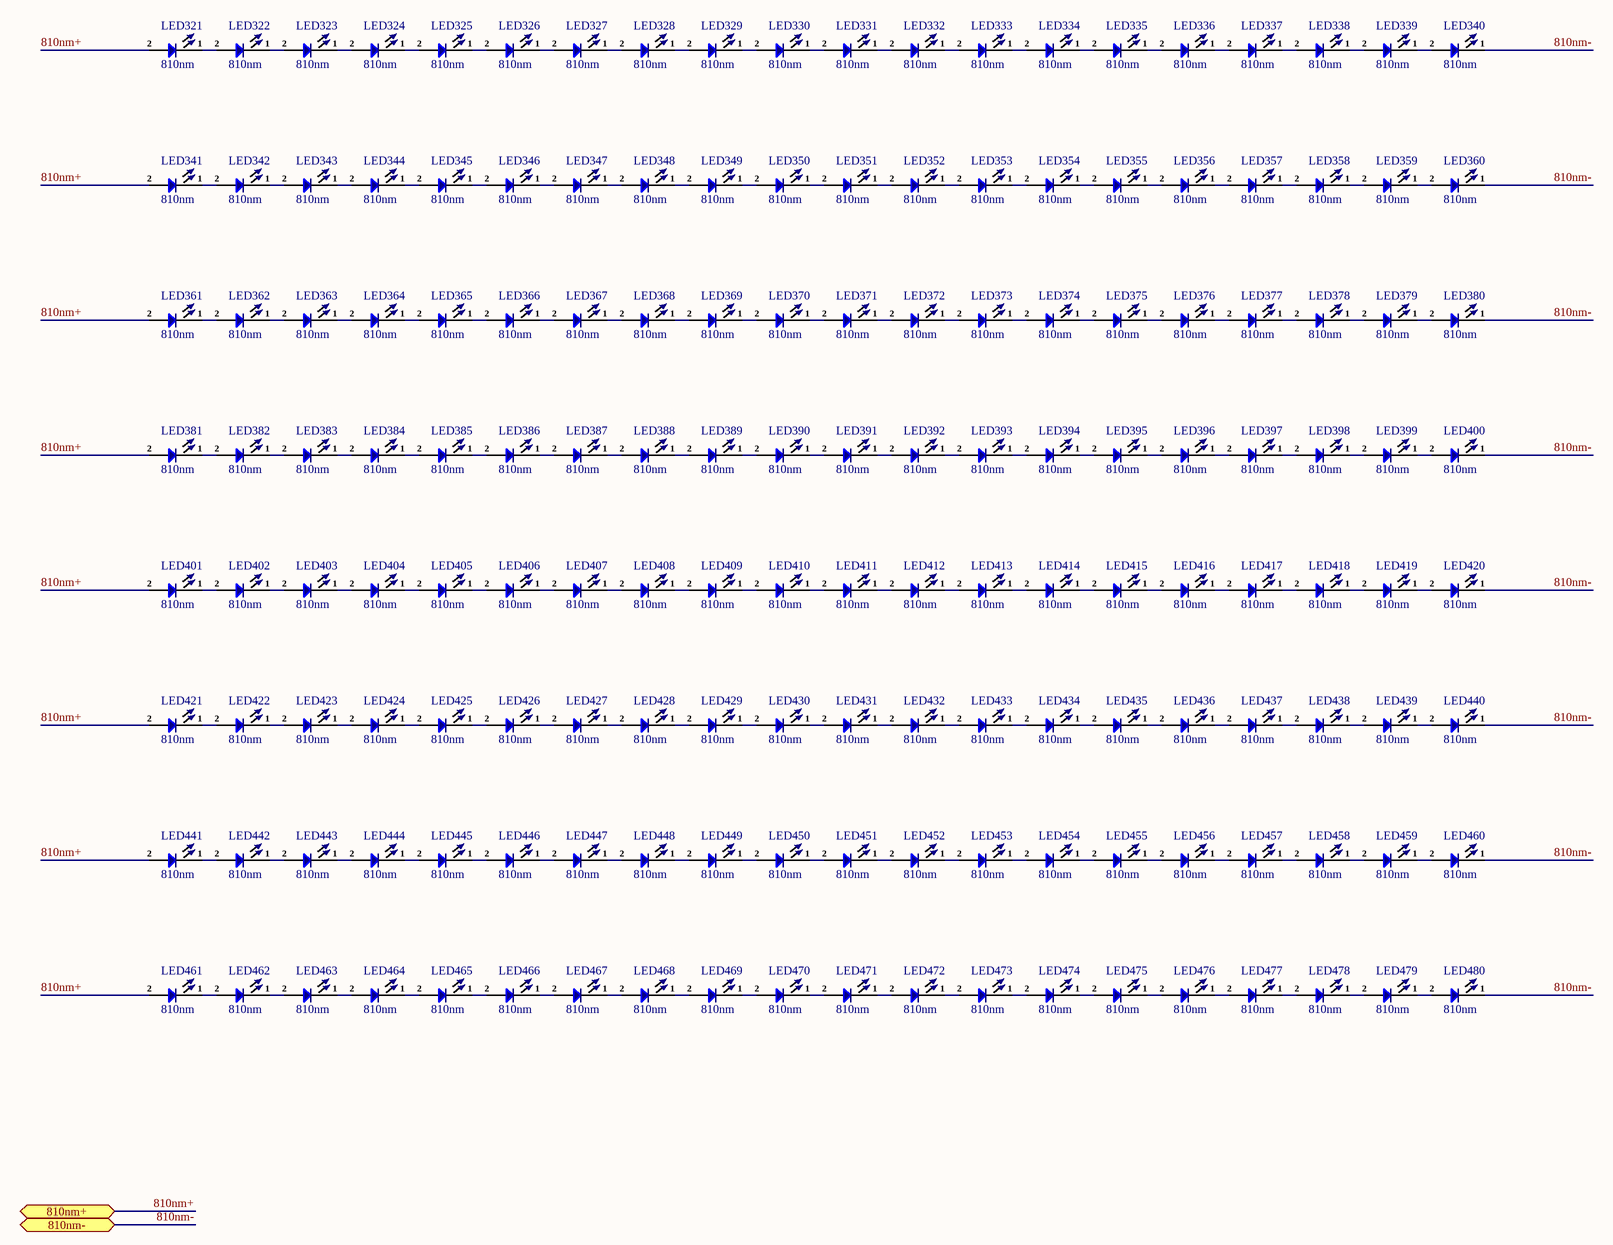
[diagram p3: 810nm-LED-Sheet.SchDoc]

### Parts
LED321  810nm  [TH LED 3mm_]
LED322  810nm  [TH LED 3mm_]
LED323  810nm  [TH LED 3mm_]
LED324  810nm  [TH LED 3mm_]
LED325  810nm  [TH LED 3mm_]
LED326  810nm  [TH LED 3mm_]
LED327  810nm  [TH LED 3mm_]
LED328  810nm  [TH LED 3mm_]
LED329  810nm  [TH LED 3mm_]
LED330  810nm  [TH LED 3mm_]
LED331  810nm  [TH LED 3mm_]
LED332  810nm  [TH LED 3mm_]
LED333  810nm  [TH LED 3mm_]
LED334  810nm  [TH LED 3mm_]
LED335  810nm  [TH LED 3mm_]
LED336  810nm  [TH LED 3mm_]
LED337  810nm  [TH LED 3mm_]
LED338  810nm  [TH LED 3mm_]
LED339  810nm  [TH LED 3mm_]
LED340  810nm  [TH LED 3mm_]
LED341  810nm  [TH LED 3mm_]
LED342  810nm  [TH LED 3mm_]
LED343  810nm  [TH LED 3mm_]
LED344  810nm  [TH LED 3mm_]
LED345  810nm  [TH LED 3mm_]
LED346  810nm  [TH LED 3mm_]
LED347  810nm  [TH LED 3mm_]
LED348  810nm  [TH LED 3mm_]
LED349  810nm  [TH LED 3mm_]
LED350  810nm  [TH LED 3mm_]
LED351  810nm  [TH LED 3mm_]
LED352  810nm  [TH LED 3mm_]
LED353  810nm  [TH LED 3mm_]
LED354  810nm  [TH LED 3mm_]
LED355  810nm  [TH LED 3mm_]
LED356  810nm  [TH LED 3mm_]
LED357  810nm  [TH LED 3mm_]
LED358  810nm  [TH LED 3mm_]
LED359  810nm  [TH LED 3mm_]
LED360  810nm  [TH LED 3mm_]
LED361  810nm  [TH LED 3mm_]
LED362  810nm  [TH LED 3mm_]
LED363  810nm  [TH LED 3mm_]
LED364  810nm  [TH LED 3mm_]
LED365  810nm  [TH LED 3mm_]
LED366  810nm  [TH LED 3mm_]
LED367  810nm  [TH LED 3mm_]
LED368  810nm  [TH LED 3mm_]
LED369  810nm  [TH LED 3mm_]
LED370  810nm  [TH LED 3mm_]
LED371  810nm  [TH LED 3mm_]
LED372  810nm  [TH LED 3mm_]
LED373  810nm  [TH LED 3mm_]
LED374  810nm  [TH LED 3mm_]
LED375  810nm  [TH LED 3mm_]
LED376  810nm  [TH LED 3mm_]
LED377  810nm  [TH LED 3mm_]
LED378  810nm  [TH LED 3mm_]
LED379  810nm  [TH LED 3mm_]
LED380  810nm  [TH LED 3mm_]
LED381  810nm  [TH LED 3mm_]
LED382  810nm  [TH LED 3mm_]
LED383  810nm  [TH LED 3mm_]
LED384  810nm  [TH LED 3mm_]
LED385  810nm  [TH LED 3mm_]
LED386  810nm  [TH LED 3mm_]
LED387  810nm  [TH LED 3mm_]
LED388  810nm  [TH LED 3mm_]
LED389  810nm  [TH LED 3mm_]
LED390  810nm  [TH LED 3mm_]
LED391  810nm  [TH LED 3mm_]
LED392  810nm  [TH LED 3mm_]
LED393  810nm  [TH LED 3mm_]
LED394  810nm  [TH LED 3mm_]
LED395  810nm  [TH LED 3mm_]
LED396  810nm  [TH LED 3mm_]
LED397  810nm  [TH LED 3mm_]
LED398  810nm  [TH LED 3mm_]
LED399  810nm  [TH LED 3mm_]
LED400  810nm  [TH LED 3mm_]
LED401  810nm  [TH LED 3mm_]
LED402  810nm  [TH LED 3mm_]
LED403  810nm  [TH LED 3mm_]
LED404  810nm  [TH LED 3mm_]
LED405  810nm  [TH LED 3mm_]
LED406  810nm  [TH LED 3mm_]
LED407  810nm  [TH LED 3mm_]
LED408  810nm  [TH LED 3mm_]
LED409  810nm  [TH LED 3mm_]
LED410  810nm  [TH LED 3mm_]
LED411  810nm  [TH LED 3mm_]
LED412  810nm  [TH LED 3mm_]
LED413  810nm  [TH LED 3mm_]
LED414  810nm  [TH LED 3mm_]
LED415  810nm  [TH LED 3mm_]
LED416  810nm  [TH LED 3mm_]
LED417  810nm  [TH LED 3mm_]
LED418  810nm  [TH LED 3mm_]
LED419  810nm  [TH LED 3mm_]
LED420  810nm  [TH LED 3mm_]
LED421  810nm  [TH LED 3mm_]
LED422  810nm  [TH LED 3mm_]
LED423  810nm  [TH LED 3mm_]
LED424  810nm  [TH LED 3mm_]
LED425  810nm  [TH LED 3mm_]
LED426  810nm  [TH LED 3mm_]
LED427  810nm  [TH LED 3mm_]
LED428  810nm  [TH LED 3mm_]
LED429  810nm  [TH LED 3mm_]
LED430  810nm  [TH LED 3mm_]
LED431  810nm  [TH LED 3mm_]
LED432  810nm  [TH LED 3mm_]
LED433  810nm  [TH LED 3mm_]
LED434  810nm  [TH LED 3mm_]
LED435  810nm  [TH LED 3mm_]
LED436  810nm  [TH LED 3mm_]
LED437  810nm  [TH LED 3mm_]
LED438  810nm  [TH LED 3mm_]
LED439  810nm  [TH LED 3mm_]
LED440  810nm  [TH LED 3mm_]
LED441  810nm  [TH LED 3mm_]
LED442  810nm  [TH LED 3mm_]
LED443  810nm  [TH LED 3mm_]
LED444  810nm  [TH LED 3mm_]
LED445  810nm  [TH LED 3mm_]
LED446  810nm  [TH LED 3mm_]
LED447  810nm  [TH LED 3mm_]
LED448  810nm  [TH LED 3mm_]
LED449  810nm  [TH LED 3mm_]
LED450  810nm  [TH LED 3mm_]
LED451  810nm  [TH LED 3mm_]
LED452  810nm  [TH LED 3mm_]
LED453  810nm  [TH LED 3mm_]
LED454  810nm  [TH LED 3mm_]
LED455  810nm  [TH LED 3mm_]
LED456  810nm  [TH LED 3mm_]
LED457  810nm  [TH LED 3mm_]
LED458  810nm  [TH LED 3mm_]
LED459  810nm  [TH LED 3mm_]
LED460  810nm  [TH LED 3mm_]
LED461  810nm  [TH LED 3mm_]
LED462  810nm  [TH LED 3mm_]
LED463  810nm  [TH LED 3mm_]
LED464  810nm  [TH LED 3mm_]
LED465  810nm  [TH LED 3mm_]
LED466  810nm  [TH LED 3mm_]
LED467  810nm  [TH LED 3mm_]
LED468  810nm  [TH LED 3mm_]
LED469  810nm  [TH LED 3mm_]
LED470  810nm  [TH LED 3mm_]
LED471  810nm  [TH LED 3mm_]
LED472  810nm  [TH LED 3mm_]
LED473  810nm  [TH LED 3mm_]
LED474  810nm  [TH LED 3mm_]
LED475  810nm  [TH LED 3mm_]
LED476  810nm  [TH LED 3mm_]
LED477  810nm  [TH LED 3mm_]
LED478  810nm  [TH LED 3mm_]
LED479  810nm  [TH LED 3mm_]
LED480  810nm  [TH LED 3mm_]

### Ports
810nm+ (bidir, see Main-Sheet[4B]), 810nm- (bidir, see Main-Sheet[4C])

### Nets
810nm+: LED321.2 LED341.2 LED361.2 LED381.2 LED401.2 LED421.2 LED441.2 LED461.2 ; port 810nm+
810nm-: LED340.1 LED360.1 LED380.1 LED400.1 LED420.1 LED440.1 LED460.1 LED480.1 ; port 810nm-
NetLED321_1: LED321.1 LED322.2
NetLED322_1: LED322.1 LED323.2
NetLED323_1: LED323.1 LED324.2
NetLED324_1: LED324.1 LED325.2
NetLED325_1: LED325.1 LED326.2
NetLED326_1: LED326.1 LED327.2
NetLED327_1: LED327.1 LED328.2
NetLED328_1: LED328.1 LED329.2
NetLED329_1: LED329.1 LED330.2
NetLED330_1: LED330.1 LED331.2
NetLED331_1: LED331.1 LED332.2
NetLED332_1: LED332.1 LED333.2
NetLED333_1: LED333.1 LED334.2
NetLED334_1: LED334.1 LED335.2
NetLED335_1: LED335.1 LED336.2
NetLED336_1: LED336.1 LED337.2
NetLED337_1: LED337.1 LED338.2
NetLED338_1: LED338.1 LED339.2
NetLED339_1: LED339.1 LED340.2
NetLED341_1: LED341.1 LED342.2
NetLED342_1: LED342.1 LED343.2
NetLED343_1: LED343.1 LED344.2
NetLED344_1: LED344.1 LED345.2
NetLED345_1: LED345.1 LED346.2
NetLED346_1: LED346.1 LED347.2
NetLED347_1: LED347.1 LED348.2
NetLED348_1: LED348.1 LED349.2
NetLED349_1: LED349.1 LED350.2
NetLED350_1: LED350.1 LED351.2
NetLED351_1: LED351.1 LED352.2
NetLED352_1: LED352.1 LED353.2
NetLED353_1: LED353.1 LED354.2
NetLED354_1: LED354.1 LED355.2
NetLED355_1: LED355.1 LED356.2
NetLED356_1: LED356.1 LED357.2
NetLED357_1: LED357.1 LED358.2
NetLED358_1: LED358.1 LED359.2
NetLED359_1: LED359.1 LED360.2
NetLED361_1: LED361.1 LED362.2
NetLED362_1: LED362.1 LED363.2
NetLED363_1: LED363.1 LED364.2
NetLED364_1: LED364.1 LED365.2
NetLED365_1: LED365.1 LED366.2
NetLED366_1: LED366.1 LED367.2
NetLED367_1: LED367.1 LED368.2
NetLED368_1: LED368.1 LED369.2
NetLED369_1: LED369.1 LED370.2
NetLED370_1: LED370.1 LED371.2
NetLED371_1: LED371.1 LED372.2
NetLED372_1: LED372.1 LED373.2
NetLED373_1: LED373.1 LED374.2
NetLED374_1: LED374.1 LED375.2
NetLED375_1: LED375.1 LED376.2
NetLED376_1: LED376.1 LED377.2
NetLED377_1: LED377.1 LED378.2
NetLED378_1: LED378.1 LED379.2
NetLED379_1: LED379.1 LED380.2
NetLED381_1: LED381.1 LED382.2
NetLED382_1: LED382.1 LED383.2
NetLED383_1: LED383.1 LED384.2
NetLED384_1: LED384.1 LED385.2
NetLED385_1: LED385.1 LED386.2
NetLED386_1: LED386.1 LED387.2
NetLED387_1: LED387.1 LED388.2
NetLED388_1: LED388.1 LED389.2
NetLED389_1: LED389.1 LED390.2
NetLED390_1: LED390.1 LED391.2
NetLED391_1: LED391.1 LED392.2
NetLED392_1: LED392.1 LED393.2
NetLED393_1: LED393.1 LED394.2
NetLED394_1: LED394.1 LED395.2
NetLED395_1: LED395.1 LED396.2
NetLED396_1: LED396.1 LED397.2
NetLED397_1: LED397.1 LED398.2
NetLED398_1: LED398.1 LED399.2
NetLED399_1: LED399.1 LED400.2
NetLED401_1: LED401.1 LED402.2
NetLED402_1: LED402.1 LED403.2
NetLED403_1: LED403.1 LED404.2
NetLED404_1: LED404.1 LED405.2
NetLED405_1: LED405.1 LED406.2
NetLED406_1: LED406.1 LED407.2
NetLED407_1: LED407.1 LED408.2
NetLED408_1: LED408.1 LED409.2
NetLED409_1: LED409.1 LED410.2
NetLED410_1: LED410.1 LED411.2
NetLED411_1: LED411.1 LED412.2
NetLED412_1: LED412.1 LED413.2
NetLED413_1: LED413.1 LED414.2
NetLED414_1: LED414.1 LED415.2
NetLED415_1: LED415.1 LED416.2
NetLED416_1: LED416.1 LED417.2
NetLED417_1: LED417.1 LED418.2
NetLED418_1: LED418.1 LED419.2
NetLED419_1: LED419.1 LED420.2
NetLED421_1: LED421.1 LED422.2
NetLED422_1: LED422.1 LED423.2
NetLED423_1: LED423.1 LED424.2
NetLED424_1: LED424.1 LED425.2
NetLED425_1: LED425.1 LED426.2
NetLED426_1: LED426.1 LED427.2
NetLED427_1: LED427.1 LED428.2
NetLED428_1: LED428.1 LED429.2
NetLED429_1: LED429.1 LED430.2
NetLED430_1: LED430.1 LED431.2
NetLED431_1: LED431.1 LED432.2
NetLED432_1: LED432.1 LED433.2
NetLED433_1: LED433.1 LED434.2
NetLED434_1: LED434.1 LED435.2
NetLED435_1: LED435.1 LED436.2
NetLED436_1: LED436.1 LED437.2
NetLED437_1: LED437.1 LED438.2
NetLED438_1: LED438.1 LED439.2
NetLED439_1: LED439.1 LED440.2
NetLED441_1: LED441.1 LED442.2
NetLED442_1: LED442.1 LED443.2
NetLED443_1: LED443.1 LED444.2
NetLED444_1: LED444.1 LED445.2
NetLED445_1: LED445.1 LED446.2
NetLED446_1: LED446.1 LED447.2
NetLED447_1: LED447.1 LED448.2
NetLED448_1: LED448.1 LED449.2
NetLED449_1: LED449.1 LED450.2
NetLED450_1: LED450.1 LED451.2
NetLED451_1: LED451.1 LED452.2
NetLED452_1: LED452.1 LED453.2
NetLED453_1: LED453.1 LED454.2
NetLED454_1: LED454.1 LED455.2
NetLED455_1: LED455.1 LED456.2
NetLED456_1: LED456.1 LED457.2
NetLED457_1: LED457.1 LED458.2
NetLED458_1: LED458.1 LED459.2
NetLED459_1: LED459.1 LED460.2
NetLED461_1: LED461.1 LED462.2
NetLED462_1: LED462.1 LED463.2
NetLED463_1: LED463.1 LED464.2
NetLED464_1: LED464.1 LED465.2
NetLED465_1: LED465.1 LED466.2
NetLED466_1: LED466.1 LED467.2
NetLED467_1: LED467.1 LED468.2
NetLED468_1: LED468.1 LED469.2
NetLED469_1: LED469.1 LED470.2
NetLED470_1: LED470.1 LED471.2
NetLED471_1: LED471.1 LED472.2
NetLED472_1: LED472.1 LED473.2
NetLED473_1: LED473.1 LED474.2
NetLED474_1: LED474.1 LED475.2
NetLED475_1: LED475.1 LED476.2
NetLED476_1: LED476.1 LED477.2
NetLED477_1: LED477.1 LED478.2
NetLED478_1: LED478.1 LED479.2
NetLED479_1: LED479.1 LED480.2

### Notes on the sheet
- File:
- Title:
- Date:
- Page
- Num:
- Total:
- Drawn By: Huzaifa Ali

### Library data of the parts
LED321-LED480 = IR LED 3mm: IR Led 3mm Through; ComponentLink1Description: Aliexpress; ComponentLink1URL: https://nl.aliexpress.com/item/32950109432.html?spm=a2g0o.productlist.0.0.2d9749ecxdTGvK&algo_pvid=f3c88197-d0dd-4360-badc-ef5a9d1d435b&algo_exp_id=f3c88197-d0dd-4360-badc-ef5a9d1d435b-1&pdp_ext_f=%7B%22sku_id%22%3A%2266309321327%22%7D

## Sheet 850nm-LED-Sheet.SchDoc
size 420 x 297 mm; SheetNumber: 5; SheetTotal: 6
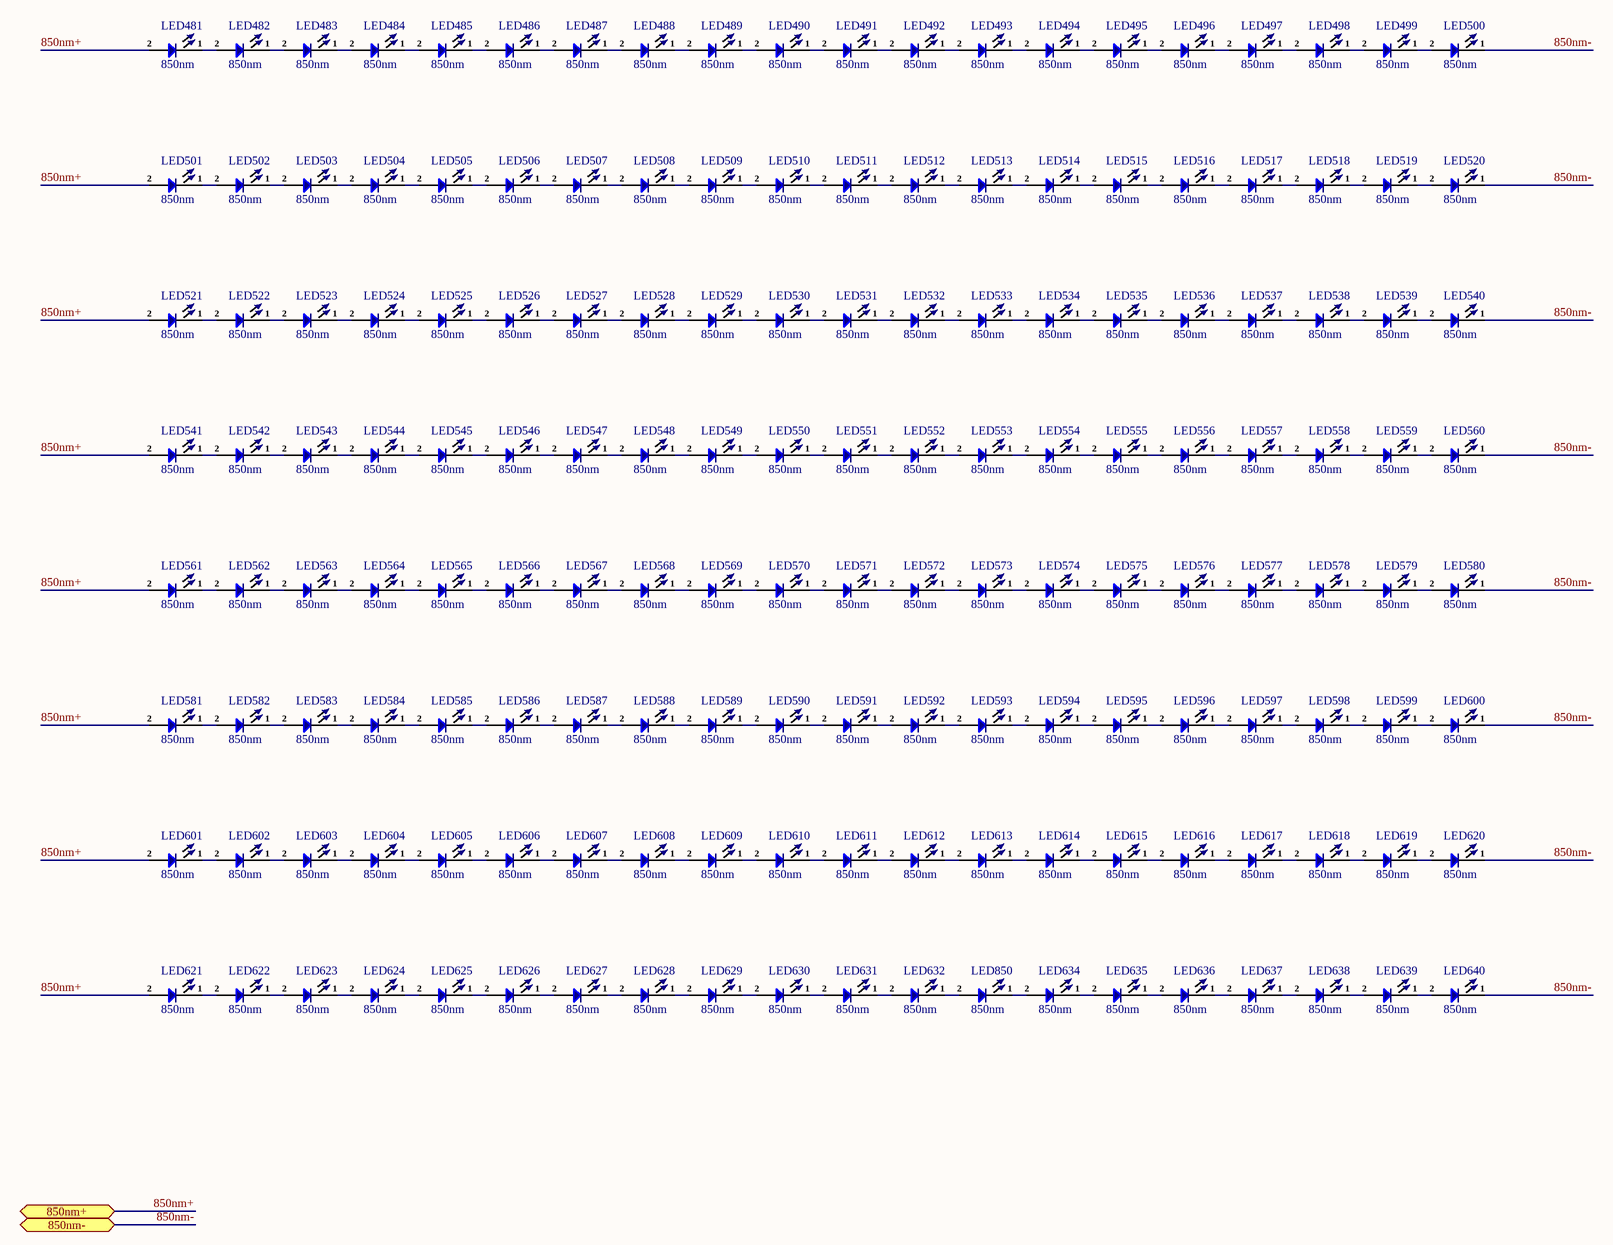
[diagram p4: 850nm-LED-Sheet.SchDoc]

### Parts
LED481  850nm  [TH LED 3mm_]
LED482  850nm  [TH LED 3mm_]
LED483  850nm  [TH LED 3mm_]
LED484  850nm  [TH LED 3mm_]
LED485  850nm  [TH LED 3mm_]
LED486  850nm  [TH LED 3mm_]
LED487  850nm  [TH LED 3mm_]
LED488  850nm  [TH LED 3mm_]
LED489  850nm  [TH LED 3mm_]
LED490  850nm  [TH LED 3mm_]
LED491  850nm  [TH LED 3mm_]
LED492  850nm  [TH LED 3mm_]
LED493  850nm  [TH LED 3mm_]
LED494  850nm  [TH LED 3mm_]
LED495  850nm  [TH LED 3mm_]
LED496  850nm  [TH LED 3mm_]
LED497  850nm  [TH LED 3mm_]
LED498  850nm  [TH LED 3mm_]
LED499  850nm  [TH LED 3mm_]
LED500  850nm  [TH LED 3mm_]
LED501  850nm  [TH LED 3mm_]
LED502  850nm  [TH LED 3mm_]
LED503  850nm  [TH LED 3mm_]
LED504  850nm  [TH LED 3mm_]
LED505  850nm  [TH LED 3mm_]
LED506  850nm  [TH LED 3mm_]
LED507  850nm  [TH LED 3mm_]
LED508  850nm  [TH LED 3mm_]
LED509  850nm  [TH LED 3mm_]
LED510  850nm  [TH LED 3mm_]
LED511  850nm  [TH LED 3mm_]
LED512  850nm  [TH LED 3mm_]
LED513  850nm  [TH LED 3mm_]
LED514  850nm  [TH LED 3mm_]
LED515  850nm  [TH LED 3mm_]
LED516  850nm  [TH LED 3mm_]
LED517  850nm  [TH LED 3mm_]
LED518  850nm  [TH LED 3mm_]
LED519  850nm  [TH LED 3mm_]
LED520  850nm  [TH LED 3mm_]
LED521  850nm  [TH LED 3mm_]
LED522  850nm  [TH LED 3mm_]
LED523  850nm  [TH LED 3mm_]
LED524  850nm  [TH LED 3mm_]
LED525  850nm  [TH LED 3mm_]
LED526  850nm  [TH LED 3mm_]
LED527  850nm  [TH LED 3mm_]
LED528  850nm  [TH LED 3mm_]
LED529  850nm  [TH LED 3mm_]
LED530  850nm  [TH LED 3mm_]
LED531  850nm  [TH LED 3mm_]
LED532  850nm  [TH LED 3mm_]
LED533  850nm  [TH LED 3mm_]
LED534  850nm  [TH LED 3mm_]
LED535  850nm  [TH LED 3mm_]
LED536  850nm  [TH LED 3mm_]
LED537  850nm  [TH LED 3mm_]
LED538  850nm  [TH LED 3mm_]
LED539  850nm  [TH LED 3mm_]
LED540  850nm  [TH LED 3mm_]
LED541  850nm  [TH LED 3mm_]
LED542  850nm  [TH LED 3mm_]
LED543  850nm  [TH LED 3mm_]
LED544  850nm  [TH LED 3mm_]
LED545  850nm  [TH LED 3mm_]
LED546  850nm  [TH LED 3mm_]
LED547  850nm  [TH LED 3mm_]
LED548  850nm  [TH LED 3mm_]
LED549  850nm  [TH LED 3mm_]
LED550  850nm  [TH LED 3mm_]
LED551  850nm  [TH LED 3mm_]
LED552  850nm  [TH LED 3mm_]
LED553  850nm  [TH LED 3mm_]
LED554  850nm  [TH LED 3mm_]
LED555  850nm  [TH LED 3mm_]
LED556  850nm  [TH LED 3mm_]
LED557  850nm  [TH LED 3mm_]
LED558  850nm  [TH LED 3mm_]
LED559  850nm  [TH LED 3mm_]
LED560  850nm  [TH LED 3mm_]
LED561  850nm  [TH LED 3mm_]
LED562  850nm  [TH LED 3mm_]
LED563  850nm  [TH LED 3mm_]
LED564  850nm  [TH LED 3mm_]
LED565  850nm  [TH LED 3mm_]
LED566  850nm  [TH LED 3mm_]
LED567  850nm  [TH LED 3mm_]
LED568  850nm  [TH LED 3mm_]
LED569  850nm  [TH LED 3mm_]
LED570  850nm  [TH LED 3mm_]
LED571  850nm  [TH LED 3mm_]
LED572  850nm  [TH LED 3mm_]
LED573  850nm  [TH LED 3mm_]
LED574  850nm  [TH LED 3mm_]
LED575  850nm  [TH LED 3mm_]
LED576  850nm  [TH LED 3mm_]
LED577  850nm  [TH LED 3mm_]
LED578  850nm  [TH LED 3mm_]
LED579  850nm  [TH LED 3mm_]
LED580  850nm  [TH LED 3mm_]
LED581  850nm  [TH LED 3mm_]
LED582  850nm  [TH LED 3mm_]
LED583  850nm  [TH LED 3mm_]
LED584  850nm  [TH LED 3mm_]
LED585  850nm  [TH LED 3mm_]
LED586  850nm  [TH LED 3mm_]
LED587  850nm  [TH LED 3mm_]
LED588  850nm  [TH LED 3mm_]
LED589  850nm  [TH LED 3mm_]
LED590  850nm  [TH LED 3mm_]
LED591  850nm  [TH LED 3mm_]
LED592  850nm  [TH LED 3mm_]
LED593  850nm  [TH LED 3mm_]
LED594  850nm  [TH LED 3mm_]
LED595  850nm  [TH LED 3mm_]
LED596  850nm  [TH LED 3mm_]
LED597  850nm  [TH LED 3mm_]
LED598  850nm  [TH LED 3mm_]
LED599  850nm  [TH LED 3mm_]
LED600  850nm  [TH LED 3mm_]
LED601  850nm  [TH LED 3mm_]
LED602  850nm  [TH LED 3mm_]
LED603  850nm  [TH LED 3mm_]
LED604  850nm  [TH LED 3mm_]
LED605  850nm  [TH LED 3mm_]
LED606  850nm  [TH LED 3mm_]
LED607  850nm  [TH LED 3mm_]
LED608  850nm  [TH LED 3mm_]
LED609  850nm  [TH LED 3mm_]
LED610  850nm  [TH LED 3mm_]
LED611  850nm  [TH LED 3mm_]
LED612  850nm  [TH LED 3mm_]
LED613  850nm  [TH LED 3mm_]
LED614  850nm  [TH LED 3mm_]
LED615  850nm  [TH LED 3mm_]
LED616  850nm  [TH LED 3mm_]
LED617  850nm  [TH LED 3mm_]
LED618  850nm  [TH LED 3mm_]
LED619  850nm  [TH LED 3mm_]
LED620  850nm  [TH LED 3mm_]
LED621  850nm  [TH LED 3mm_]
LED622  850nm  [TH LED 3mm_]
LED623  850nm  [TH LED 3mm_]
LED624  850nm  [TH LED 3mm_]
LED625  850nm  [TH LED 3mm_]
LED626  850nm  [TH LED 3mm_]
LED627  850nm  [TH LED 3mm_]
LED628  850nm  [TH LED 3mm_]
LED629  850nm  [TH LED 3mm_]
LED630  850nm  [TH LED 3mm_]
LED631  850nm  [TH LED 3mm_]
LED632  850nm  [TH LED 3mm_]
LED634  850nm  [TH LED 3mm_]
LED635  850nm  [TH LED 3mm_]
LED636  850nm  [TH LED 3mm_]
LED637  850nm  [TH LED 3mm_]
LED638  850nm  [TH LED 3mm_]
LED639  850nm  [TH LED 3mm_]
LED640  850nm  [TH LED 3mm_]
LED850  850nm  [TH LED 3mm_]

### Ports
850nm+ (bidir, see Main-Sheet[4B]), 850nm- (bidir, see Main-Sheet[4B])

### Nets
850nm+: LED481.2 LED501.2 LED521.2 LED541.2 LED561.2 LED581.2 LED601.2 LED621.2 ; port 850nm+
850nm-: LED500.1 LED520.1 LED540.1 LED560.1 LED580.1 LED600.1 LED620.1 LED640.1 ; port 850nm-
NetLED481_1: LED481.1 LED482.2
NetLED482_1: LED482.1 LED483.2
NetLED483_1: LED483.1 LED484.2
NetLED484_1: LED484.1 LED485.2
NetLED485_1: LED485.1 LED486.2
NetLED486_1: LED486.1 LED487.2
NetLED487_1: LED487.1 LED488.2
NetLED488_1: LED488.1 LED489.2
NetLED489_1: LED489.1 LED490.2
NetLED490_1: LED490.1 LED491.2
NetLED491_1: LED491.1 LED492.2
NetLED492_1: LED492.1 LED493.2
NetLED493_1: LED493.1 LED494.2
NetLED494_1: LED494.1 LED495.2
NetLED495_1: LED495.1 LED496.2
NetLED496_1: LED496.1 LED497.2
NetLED497_1: LED497.1 LED498.2
NetLED498_1: LED498.1 LED499.2
NetLED499_1: LED499.1 LED500.2
NetLED501_1: LED501.1 LED502.2
NetLED502_1: LED502.1 LED503.2
NetLED503_1: LED503.1 LED504.2
NetLED504_1: LED504.1 LED505.2
NetLED505_1: LED505.1 LED506.2
NetLED506_1: LED506.1 LED507.2
NetLED507_1: LED507.1 LED508.2
NetLED508_1: LED508.1 LED509.2
NetLED509_1: LED509.1 LED510.2
NetLED510_1: LED510.1 LED511.2
NetLED511_1: LED511.1 LED512.2
NetLED512_1: LED512.1 LED513.2
NetLED513_1: LED513.1 LED514.2
NetLED514_1: LED514.1 LED515.2
NetLED515_1: LED515.1 LED516.2
NetLED516_1: LED516.1 LED517.2
NetLED517_1: LED517.1 LED518.2
NetLED518_1: LED518.1 LED519.2
NetLED519_1: LED519.1 LED520.2
NetLED521_1: LED521.1 LED522.2
NetLED522_1: LED522.1 LED523.2
NetLED523_1: LED523.1 LED524.2
NetLED524_1: LED524.1 LED525.2
NetLED525_1: LED525.1 LED526.2
NetLED526_1: LED526.1 LED527.2
NetLED527_1: LED527.1 LED528.2
NetLED528_1: LED528.1 LED529.2
NetLED529_1: LED529.1 LED530.2
NetLED530_1: LED530.1 LED531.2
NetLED531_1: LED531.1 LED532.2
NetLED532_1: LED532.1 LED533.2
NetLED533_1: LED533.1 LED534.2
NetLED534_1: LED534.1 LED535.2
NetLED535_1: LED535.1 LED536.2
NetLED536_1: LED536.1 LED537.2
NetLED537_1: LED537.1 LED538.2
NetLED538_1: LED538.1 LED539.2
NetLED539_1: LED539.1 LED540.2
NetLED541_1: LED541.1 LED542.2
NetLED542_1: LED542.1 LED543.2
NetLED543_1: LED543.1 LED544.2
NetLED544_1: LED544.1 LED545.2
NetLED545_1: LED545.1 LED546.2
NetLED546_1: LED546.1 LED547.2
NetLED547_1: LED547.1 LED548.2
NetLED548_1: LED548.1 LED549.2
NetLED549_1: LED549.1 LED550.2
NetLED550_1: LED550.1 LED551.2
NetLED551_1: LED551.1 LED552.2
NetLED552_1: LED552.1 LED553.2
NetLED553_1: LED553.1 LED554.2
NetLED554_1: LED554.1 LED555.2
NetLED555_1: LED555.1 LED556.2
NetLED556_1: LED556.1 LED557.2
NetLED557_1: LED557.1 LED558.2
NetLED558_1: LED558.1 LED559.2
NetLED559_1: LED559.1 LED560.2
NetLED561_1: LED561.1 LED562.2
NetLED562_1: LED562.1 LED563.2
NetLED563_1: LED563.1 LED564.2
NetLED564_1: LED564.1 LED565.2
NetLED565_1: LED565.1 LED566.2
NetLED566_1: LED566.1 LED567.2
NetLED567_1: LED567.1 LED568.2
NetLED568_1: LED568.1 LED569.2
NetLED569_1: LED569.1 LED570.2
NetLED570_1: LED570.1 LED571.2
NetLED571_1: LED571.1 LED572.2
NetLED572_1: LED572.1 LED573.2
NetLED573_1: LED573.1 LED574.2
NetLED574_1: LED574.1 LED575.2
NetLED575_1: LED575.1 LED576.2
NetLED576_1: LED576.1 LED577.2
NetLED577_1: LED577.1 LED578.2
NetLED578_1: LED578.1 LED579.2
NetLED579_1: LED579.1 LED580.2
NetLED581_1: LED581.1 LED582.2
NetLED582_1: LED582.1 LED583.2
NetLED583_1: LED583.1 LED584.2
NetLED584_1: LED584.1 LED585.2
NetLED585_1: LED585.1 LED586.2
NetLED586_1: LED586.1 LED587.2
NetLED587_1: LED587.1 LED588.2
NetLED588_1: LED588.1 LED589.2
NetLED589_1: LED589.1 LED590.2
NetLED590_1: LED590.1 LED591.2
NetLED591_1: LED591.1 LED592.2
NetLED592_1: LED592.1 LED593.2
NetLED593_1: LED593.1 LED594.2
NetLED594_1: LED594.1 LED595.2
NetLED595_1: LED595.1 LED596.2
NetLED596_1: LED596.1 LED597.2
NetLED597_1: LED597.1 LED598.2
NetLED598_1: LED598.1 LED599.2
NetLED599_1: LED599.1 LED600.2
NetLED601_1: LED601.1 LED602.2
NetLED602_1: LED602.1 LED603.2
NetLED603_1: LED603.1 LED604.2
NetLED604_1: LED604.1 LED605.2
NetLED605_1: LED605.1 LED606.2
NetLED606_1: LED606.1 LED607.2
NetLED607_1: LED607.1 LED608.2
NetLED608_1: LED608.1 LED609.2
NetLED609_1: LED609.1 LED610.2
NetLED610_1: LED610.1 LED611.2
NetLED611_1: LED611.1 LED612.2
NetLED612_1: LED612.1 LED613.2
NetLED613_1: LED613.1 LED614.2
NetLED614_1: LED614.1 LED615.2
NetLED615_1: LED615.1 LED616.2
NetLED616_1: LED616.1 LED617.2
NetLED617_1: LED617.1 LED618.2
NetLED618_1: LED618.1 LED619.2
NetLED619_1: LED619.1 LED620.2
NetLED621_1: LED621.1 LED622.2
NetLED622_1: LED622.1 LED623.2
NetLED623_1: LED623.1 LED624.2
NetLED624_1: LED624.1 LED625.2
NetLED625_1: LED625.1 LED626.2
NetLED626_1: LED626.1 LED627.2
NetLED627_1: LED627.1 LED628.2
NetLED628_1: LED628.1 LED629.2
NetLED629_1: LED629.1 LED630.2
NetLED630_1: LED630.1 LED631.2
NetLED631_1: LED631.1 LED632.2
NetLED632_1: LED632.1 LED850.2
NetLED634_1: LED634.1 LED635.2
NetLED634_2: LED634.2 LED850.1
NetLED635_1: LED635.1 LED636.2
NetLED636_1: LED636.1 LED637.2
NetLED637_1: LED637.1 LED638.2
NetLED638_1: LED638.1 LED639.2
NetLED639_1: LED639.1 LED640.2

### Notes on the sheet
- File:
- Title:
- Date:
- Page
- Num:
- Total:
- Drawn By: Huzaifa Ali

### Library data of the parts
LED481-LED632 LED634-LED640 LED850 = IR LED 3mm: IR Led 3mm Through; ComponentLink1Description: Aliexpress; ComponentLink1URL: https://nl.aliexpress.com/item/32950109432.html?spm=a2g0o.productlist.0.0.2d9749ecxdTGvK&algo_pvid=f3c88197-d0dd-4360-badc-ef5a9d1d435b&algo_exp_id=f3c88197-d0dd-4360-badc-ef5a9d1d435b-1&pdp_ext_f=%7B%22sku_id%22%3A%2266309321327%22%7D